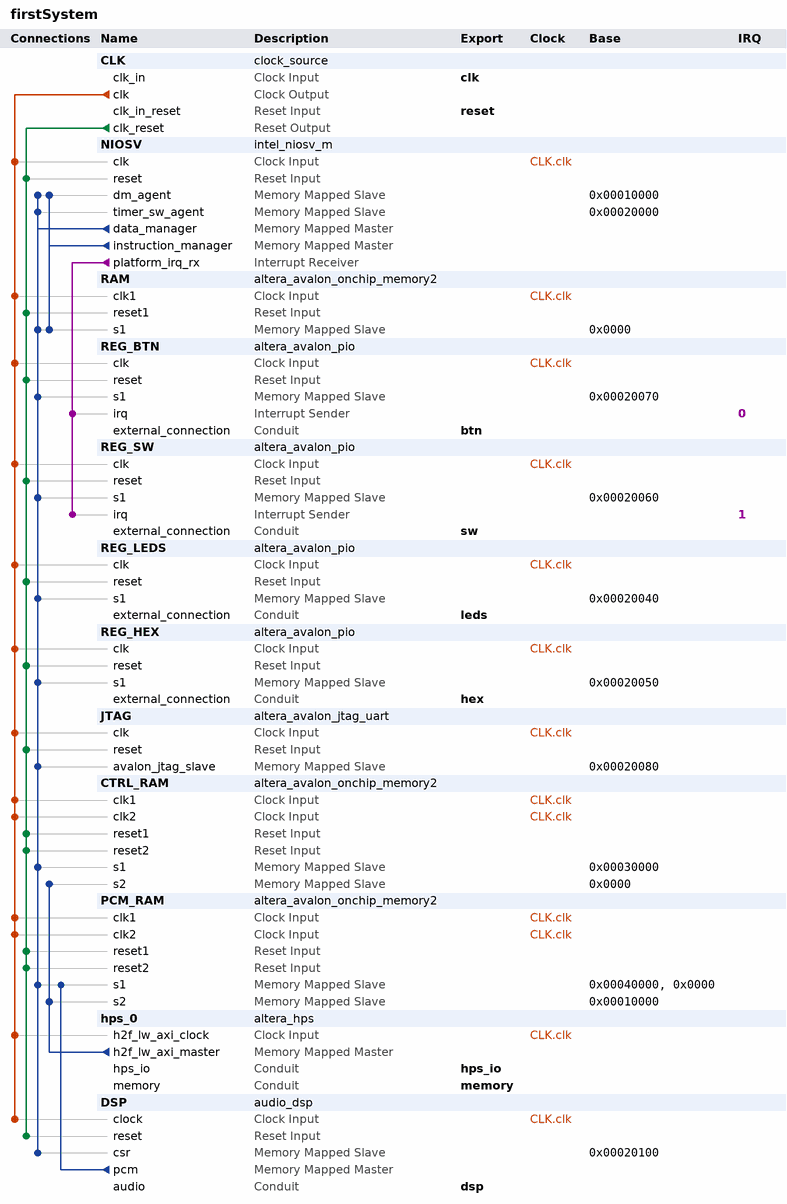
[diagram p0: system contents]
# Platform Designer (Qsys) system firstSystem, Cyclone V 5CSEMA5F31C6
# Parameters at their usual value, and those the tool derives, are not listed.
package require -exact qsys 25.1
create_system firstSystem
set_project_property DEVICE_FAMILY {Cyclone V}
set_project_property DEVICE 5CSEMA5F31C6

add_instance CLK clock_source 25.1
set_instance_parameter_value CLK clockFrequency 50000000

add_instance NIOSV intel_niosv_m 26.0.0
set_instance_parameter_value NIOSV enableAvalonInterface false
set_instance_parameter_value NIOSV enableDebugReset false
set_instance_parameter_value NIOSV enableECCFull false
set_instance_parameter_value NIOSV enableECCLite false
set_instance_parameter_value NIOSV hartId 0
set_instance_parameter_value NIOSV interruptMode 0
set_instance_parameter_value NIOSV pipelineArch true
set_instance_parameter_value NIOSV resetSlave RAM.s1

add_instance RAM altera_avalon_onchip_memory2 25.1
set_instance_parameter_value RAM dataWidth 32
set_instance_parameter_value RAM dualPort false
set_instance_parameter_value RAM initMemContent true
set_instance_parameter_value RAM initializationFileName onchip_mem.hex
set_instance_parameter_value RAM memorySize 65536

add_instance REG_BTN altera_avalon_pio 25.1
set_instance_parameter_value REG_BTN captureEdge true
set_instance_parameter_value REG_BTN direction Input
set_instance_parameter_value REG_BTN edgeType FALLING
set_instance_parameter_value REG_BTN generateIRQ true
set_instance_parameter_value REG_BTN width 4

add_instance REG_SW altera_avalon_pio 25.1
set_instance_parameter_value REG_SW direction Input
set_instance_parameter_value REG_SW generateIRQ true
set_instance_parameter_value REG_SW width 10

add_instance REG_LEDS altera_avalon_pio 25.1
set_instance_parameter_value REG_LEDS direction Output
set_instance_parameter_value REG_LEDS width 10

add_instance REG_HEX altera_avalon_pio 25.1
set_instance_parameter_value REG_HEX direction Output
set_instance_parameter_value REG_HEX width 32

add_instance JTAG altera_avalon_jtag_uart 25.1
set_instance_parameter_value JTAG simInteractiveOptions NO_INTERACTIVE_WINDOWS

add_instance CTRL_RAM altera_avalon_onchip_memory2 25.1
set_instance_parameter_value CTRL_RAM dataWidth 32
set_instance_parameter_value CTRL_RAM dualPort true
set_instance_parameter_value CTRL_RAM initMemContent false
set_instance_parameter_value CTRL_RAM initializationFileName onchip_mem.hex
set_instance_parameter_value CTRL_RAM memorySize 4096
set_instance_parameter_value CTRL_RAM resetrequest_enabled false

add_instance PCM_RAM altera_avalon_onchip_memory2 25.1
set_instance_parameter_value PCM_RAM dataWidth 32
set_instance_parameter_value PCM_RAM dualPort true
set_instance_parameter_value PCM_RAM initMemContent false
set_instance_parameter_value PCM_RAM initializationFileName onchip_mem.hex
set_instance_parameter_value PCM_RAM memorySize 65536
set_instance_parameter_value PCM_RAM resetrequest_enabled false

add_instance hps_0 altera_hps 25.1
set_instance_parameter_value hps_0 EMAC1_Mode RGMII
set_instance_parameter_value hps_0 EMAC1_PinMuxing {HPS I/O Set 0}
set_instance_parameter_value hps_0 F2SCLK_COLDRST_Enable false
set_instance_parameter_value hps_0 F2SCLK_DBGRST_Enable false
set_instance_parameter_value hps_0 F2SCLK_WARMRST_Enable false
set_instance_parameter_value hps_0 F2SINTERRUPT_Enable false
set_instance_parameter_value hps_0 F2S_Width 0
set_instance_parameter_value hps_0 FPGA_PERIPHERAL_OUTPUT_CLOCK_FREQ_EMAC0_GTX_CLK 100
set_instance_parameter_value hps_0 FPGA_PERIPHERAL_OUTPUT_CLOCK_FREQ_EMAC0_MD_CLK 100.0
set_instance_parameter_value hps_0 FPGA_PERIPHERAL_OUTPUT_CLOCK_FREQ_EMAC1_GTX_CLK 100
set_instance_parameter_value hps_0 FPGA_PERIPHERAL_OUTPUT_CLOCK_FREQ_EMAC1_MD_CLK 100.0
set_instance_parameter_value hps_0 HPS_PROTOCOL DDR3
set_instance_parameter_value hps_0 I2C0_Mode I2C
set_instance_parameter_value hps_0 I2C0_PinMuxing {HPS I/O Set 0}
set_instance_parameter_value hps_0 I2C1_Mode I2C
set_instance_parameter_value hps_0 I2C1_PinMuxing {HPS I/O Set 0}
set_instance_parameter_value hps_0 LWH2F_Enable true
set_instance_parameter_value hps_0 MEM_BANKADDR_WIDTH 3
set_instance_parameter_value hps_0 MEM_CLK_FREQ 400.0
set_instance_parameter_value hps_0 MEM_COL_ADDR_WIDTH 10
set_instance_parameter_value hps_0 MEM_DQ_WIDTH 32
set_instance_parameter_value hps_0 MEM_DRV_STR RZQ/6
set_instance_parameter_value hps_0 MEM_ROW_ADDR_WIDTH 15
set_instance_parameter_value hps_0 MEM_RTT_NOM RZQ/6
set_instance_parameter_value hps_0 MEM_RTT_WR {Dynamic ODT off}
set_instance_parameter_value hps_0 MEM_TCL 7
set_instance_parameter_value hps_0 MEM_TFAW_NS 45.0
set_instance_parameter_value hps_0 MEM_TRAS_NS 36.0
set_instance_parameter_value hps_0 MEM_TRCD_NS 13.125
set_instance_parameter_value hps_0 MEM_TRFC_NS 300.0
set_instance_parameter_value hps_0 MEM_TRP_NS 13.125
set_instance_parameter_value hps_0 MEM_VENDOR Micron
set_instance_parameter_value hps_0 MEM_WTCL 7
set_instance_parameter_value hps_0 QSPI_Mode {1 SS}
set_instance_parameter_value hps_0 QSPI_PinMuxing {HPS I/O Set 0}
set_instance_parameter_value hps_0 REF_CLK_FREQ 25.0
set_instance_parameter_value hps_0 S2FCLK_USER2CLK 5
set_instance_parameter_value hps_0 S2F_Width 0
set_instance_parameter_value hps_0 SDIO_Mode {4-bit Data}
set_instance_parameter_value hps_0 SDIO_PinMuxing {HPS I/O Set 0}
set_instance_parameter_value hps_0 SPIM1_Mode {Single Slave Select}
set_instance_parameter_value hps_0 SPIM1_PinMuxing {HPS I/O Set 0}
set_instance_parameter_value hps_0 STM_Enable false
set_instance_parameter_value hps_0 TIMING_BOARD_AC_SKEW 0.02
set_instance_parameter_value hps_0 TIMING_BOARD_AC_TO_CK_SKEW 0.01
set_instance_parameter_value hps_0 TIMING_BOARD_DQ_TO_DQS_SKEW 0.05
set_instance_parameter_value hps_0 TIMING_BOARD_MAX_CK_DELAY 0.03
set_instance_parameter_value hps_0 TIMING_BOARD_MAX_DQS_DELAY 0.02
set_instance_parameter_value hps_0 TIMING_BOARD_SKEW_BETWEEN_DQS 0.06
set_instance_parameter_value hps_0 TIMING_BOARD_SKEW_CKDQS_DIMM_MAX 0.12
set_instance_parameter_value hps_0 TIMING_BOARD_SKEW_CKDQS_DIMM_MIN 0.06
set_instance_parameter_value hps_0 TIMING_BOARD_SKEW_WITHIN_DQS 0.01
set_instance_parameter_value hps_0 TIMING_TDH 65
set_instance_parameter_value hps_0 TIMING_TDQSCK 255
set_instance_parameter_value hps_0 TIMING_TDQSQ 125
set_instance_parameter_value hps_0 TIMING_TDS 30
set_instance_parameter_value hps_0 TIMING_TIH 140
set_instance_parameter_value hps_0 TIMING_TIS 190
set_instance_parameter_value hps_0 TIMING_TQSH 0.4
set_instance_parameter_value hps_0 UART0_Mode {No Flow Control}
set_instance_parameter_value hps_0 UART0_PinMuxing {HPS I/O Set 0}
set_instance_parameter_value hps_0 USB1_Mode SDR
set_instance_parameter_value hps_0 USB1_PinMuxing {HPS I/O Set 0}
set_instance_parameter_value hps_0 desired_cfg_clk_mhz 100.0
set_instance_parameter_value hps_0 desired_qspi_clk_mhz 400.0

add_instance DSP audio_dsp 1.0

# connections
add_connection CLK.clk CTRL_RAM.clk1 clock
add_connection CLK.clk CTRL_RAM.clk2 clock
add_connection CLK.clk DSP.clock clock
add_connection CLK.clk hps_0.h2f_lw_axi_clock clock
add_connection CLK.clk JTAG.clk clock
add_connection CLK.clk NIOSV.clk clock
add_connection CLK.clk PCM_RAM.clk1 clock
add_connection CLK.clk PCM_RAM.clk2 clock
add_connection CLK.clk RAM.clk1 clock
add_connection CLK.clk REG_BTN.clk clock
add_connection CLK.clk REG_HEX.clk clock
add_connection CLK.clk REG_LEDS.clk clock
add_connection CLK.clk REG_SW.clk clock
add_connection CLK.clk_reset CTRL_RAM.reset1 reset
add_connection CLK.clk_reset CTRL_RAM.reset2 reset
add_connection CLK.clk_reset DSP.reset reset
add_connection CLK.clk_reset JTAG.reset reset
add_connection CLK.clk_reset NIOSV.reset reset
add_connection CLK.clk_reset PCM_RAM.reset1 reset
add_connection CLK.clk_reset PCM_RAM.reset2 reset
add_connection CLK.clk_reset RAM.reset1 reset
add_connection CLK.clk_reset REG_BTN.reset reset
add_connection CLK.clk_reset REG_HEX.reset reset
add_connection CLK.clk_reset REG_LEDS.reset reset
add_connection CLK.clk_reset REG_SW.reset reset
add_connection DSP.pcm PCM_RAM.s1 avalon
set_connection_parameter_value DSP.pcm/PCM_RAM.s1 baseAddress 0x0000
add_connection hps_0.h2f_lw_axi_master CTRL_RAM.s2 avalon
set_connection_parameter_value hps_0.h2f_lw_axi_master/CTRL_RAM.s2 baseAddress 0x0000
add_connection hps_0.h2f_lw_axi_master PCM_RAM.s2 avalon
set_connection_parameter_value hps_0.h2f_lw_axi_master/PCM_RAM.s2 baseAddress 0x00010000
add_connection NIOSV.data_manager CTRL_RAM.s1 avalon
set_connection_parameter_value NIOSV.data_manager/CTRL_RAM.s1 baseAddress 0x00030000
add_connection NIOSV.data_manager DSP.csr avalon
set_connection_parameter_value NIOSV.data_manager/DSP.csr baseAddress 0x00020100
add_connection NIOSV.data_manager JTAG.avalon_jtag_slave avalon
set_connection_parameter_value NIOSV.data_manager/JTAG.avalon_jtag_slave baseAddress 0x00020080
add_connection NIOSV.data_manager NIOSV.dm_agent avalon
set_connection_parameter_value NIOSV.data_manager/NIOSV.dm_agent baseAddress 0x00010000
add_connection NIOSV.data_manager NIOSV.timer_sw_agent avalon
set_connection_parameter_value NIOSV.data_manager/NIOSV.timer_sw_agent baseAddress 0x00020000
add_connection NIOSV.data_manager PCM_RAM.s1 avalon
set_connection_parameter_value NIOSV.data_manager/PCM_RAM.s1 baseAddress 0x00040000
add_connection NIOSV.data_manager RAM.s1 avalon
set_connection_parameter_value NIOSV.data_manager/RAM.s1 baseAddress 0x0000
add_connection NIOSV.data_manager REG_BTN.s1 avalon
set_connection_parameter_value NIOSV.data_manager/REG_BTN.s1 baseAddress 0x00020070
add_connection NIOSV.data_manager REG_HEX.s1 avalon
set_connection_parameter_value NIOSV.data_manager/REG_HEX.s1 baseAddress 0x00020050
add_connection NIOSV.data_manager REG_LEDS.s1 avalon
set_connection_parameter_value NIOSV.data_manager/REG_LEDS.s1 baseAddress 0x00020040
add_connection NIOSV.data_manager REG_SW.s1 avalon
set_connection_parameter_value NIOSV.data_manager/REG_SW.s1 baseAddress 0x00020060
add_connection NIOSV.instruction_manager NIOSV.dm_agent avalon
set_connection_parameter_value NIOSV.instruction_manager/NIOSV.dm_agent baseAddress 0x00010000
add_connection NIOSV.instruction_manager RAM.s1 avalon
set_connection_parameter_value NIOSV.instruction_manager/RAM.s1 baseAddress 0x0000
add_connection NIOSV.platform_irq_rx REG_BTN.irq interrupt
set_connection_parameter_value NIOSV.platform_irq_rx/REG_BTN.irq irqNumber 0
add_connection NIOSV.platform_irq_rx REG_SW.irq interrupt
set_connection_parameter_value NIOSV.platform_irq_rx/REG_SW.irq irqNumber 1

# exported interfaces
add_interface btn conduit end
set_interface_property btn EXPORT_OF REG_BTN.external_connection
add_interface clk clock sink
set_interface_property clk EXPORT_OF CLK.clk_in
add_interface dsp conduit end
set_interface_property dsp EXPORT_OF DSP.audio
add_interface hex conduit end
set_interface_property hex EXPORT_OF REG_HEX.external_connection
add_interface hps_io conduit end
set_interface_property hps_io EXPORT_OF hps_0.hps_io
add_interface leds conduit end
set_interface_property leds EXPORT_OF REG_LEDS.external_connection
add_interface memory conduit end
set_interface_property memory EXPORT_OF hps_0.memory
add_interface reset reset sink
set_interface_property reset EXPORT_OF CLK.clk_in_reset
add_interface sw conduit end
set_interface_property sw EXPORT_OF REG_SW.external_connection

set_interconnect_requirement {$system} qsys_mm.clockCrossingAdapter HANDSHAKE
set_interconnect_requirement {$system} qsys_mm.enableEccProtection FALSE
set_interconnect_requirement {$system} qsys_mm.insertDefaultSlave FALSE
set_interconnect_requirement {$system} qsys_mm.maxAdditionalLatency 1

save_system firstSystem.qsys
